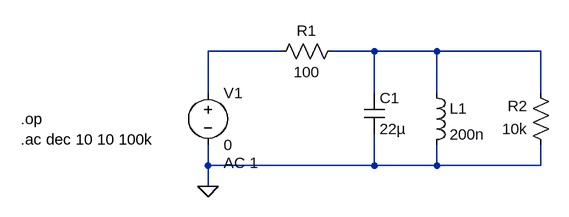
[diagram p0: schematic LC_filter_mfg_components.asc]
LC_filter_mfg_components.asc, the LTspice schematic file:
Version 4.1
SHEET 1 880 680
WIRE 224 64 112 64
WIRE 368 64 304 64
WIRE 464 64 368 64
WIRE 624 64 464 64
WIRE 112 128 112 64
WIRE 368 128 368 64
WIRE 464 128 464 64
WIRE 624 128 624 64
WIRE 112 240 112 208
WIRE 368 240 368 192
WIRE 368 240 112 240
WIRE 464 240 464 208
WIRE 464 240 368 240
WIRE 624 240 624 208
WIRE 624 240 464 240
WIRE 112 272 112 240
FLAG 112 272 0
SYMBOL voltage 112 112 R0
WINDOW 123 24 124 Left 2
WINDOW 39 0 0 Left 0
SYMATTR InstName V1
SYMATTR Value 0
SYMATTR Value2 AC 1
SYMBOL res 320 48 R90
WINDOW 0 0 56 VBottom 2
WINDOW 3 32 56 VTop 2
SYMATTR InstName R1
SYMATTR Value 100
SYMBOL res 640 224 R180
WINDOW 0 36 76 Left 2
WINDOW 3 36 40 Left 2
SYMATTR InstName R2
SYMATTR Value 10k
SYMBOL cap 352 128 R0
WINDOW 3 24 56 Left 2
SYMATTR InstName C1
SYMATTR Value 22µ
SYMATTR Description Capacitor
SYMATTR Type cap
SYMATTR SpiceLine V=10 Irms=2.44949 Rser=0.045 Lser=0 mfg="KEMET" pn="A700V226M010ATE045" type="Al electrolytic"
SYMBOL ind 448 112 R0
SYMATTR InstName L1
SYMATTR Value 200n
SYMATTR SpiceLine Ipk=110 Rser=0.00055 Rpar=140 Cpar=7.502p mfg="Bourns, Inc." pn="SRP1245A-R20M"
TEXT -176 200 Left 2 !.ac dec 10 10 100k
TEXT -176 168 Left 2 !.op

The netlist it stands for:
* LC_filter_mfg_components.asc
V1 N001 0 0 AC 1
R1 N002 N001 100
R2 0 N002 10k
C1 N002 0 22µ V=10 Irms=2.44949 Rser=0.045 Lser=0 mfg="KEMET" pn="A700V226M010ATE045" type="Al electrolytic"
L1 N002 0 200n Ipk=110 Rser=0.00055 Rpar=140 Cpar=7.502p mfg="Bourns, Inc." pn="SRP1245A-R20M"
.ac dec 10 10 100k
.op
.backanno
.end